# Altium schematic sheet Sheet1.SchDoc
size A4; SheetNumber: 1; SheetTotal: 1
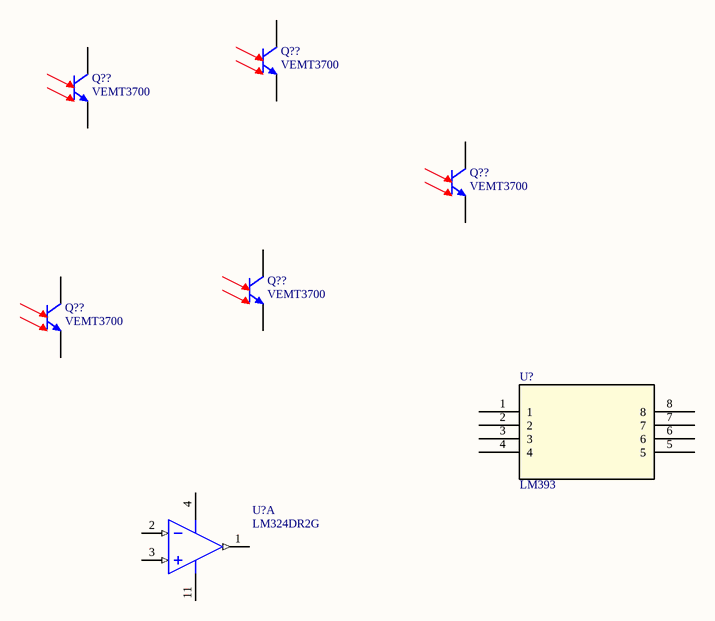
[diagram p0: Sheet1.SchDoc]

## Parts
(Parts that share a designator on the sheet are numbered #1, #2 ... from top to bottom, then left to right.)
Q??#1  VEMT3700  [VEMT3700]
Q??#2  VEMT3700  [VEMT3700]
Q??#3  VEMT3700  [VEMT3700]
Q??#4  VEMT3700  [VEMT3700]
Q??#5  VEMT3700  [VEMT3700]
U?#1  LM393  [DIP8_300]
U?#2  LM324DR2G  [SOIC-14]  (part A of 4)

## Nets

Not connected (* = marked no-connect by the designer): Q??#1 1(C) 2(E); Q??#2 1(C) 2(E); Q??#3 1(C) 2(E); Q??#4 1(C) 2(E); Q??#5 1(C) 2(E); U?#1 1 2 3 4 5 6 7 8; U?#2 1(OUT1) 2(IN1-) 3(IN1+) 4(VCC) 11(VEE/GND)

## Library data of the parts
Q??#1-Q??#5 = VEMT3700: Silicon NPN Phototransistor
U?#1 = LM393: Description; Manufacturer_Name: Texas Instruments; Copyright: Copyright (C) 2025 Ultra Librarian. All rights reserved.; Manufacturer_Part_Number: LM393; RefDes: RefDes; Type: Type
U?#2 = LM324DR_SMT_SOIC16: Single Supply Quad Operational Amplifier, 3 to 32 V, 0 to 70 degC, 14-Pin SOIC, Pb-Free, Tape and Reel; Manufacturer: On Semiconductor; VCC Max (V): 32; VCC Min (V): 3; PackageVersion: Rev. K, 05/2011; ComponentLink3URL: http://www.onsemi.com/pub_link/Collateral/751A-03.PDF; ComponentLink3Description: Package Specification; Packing: Tape and Reel; ComponentLink2URL: http://www.onsemi.cn/pub_link/Collateral/LM324-D.PDF; PackageReference: SOIC-14-751A-03; ComponentLink1URL: http://www.onsemi.com/; PackageDescription: 14-Pin Small Outline Integrated Circuit, Body 8.65 x 3.9 mm, Pitch 1.27 mm; ComponentLink1Description: Manufacturer URL; DatasheetVersion: Rev. 25; Mounting Technology: Surface Mount; RoHS: TRUE; ComponentLink2Description: Datasheet; PartNumber: LM324DR2G